# Altium project ezlo-thermostat-basic.PrjPcb (part 1 of 2)
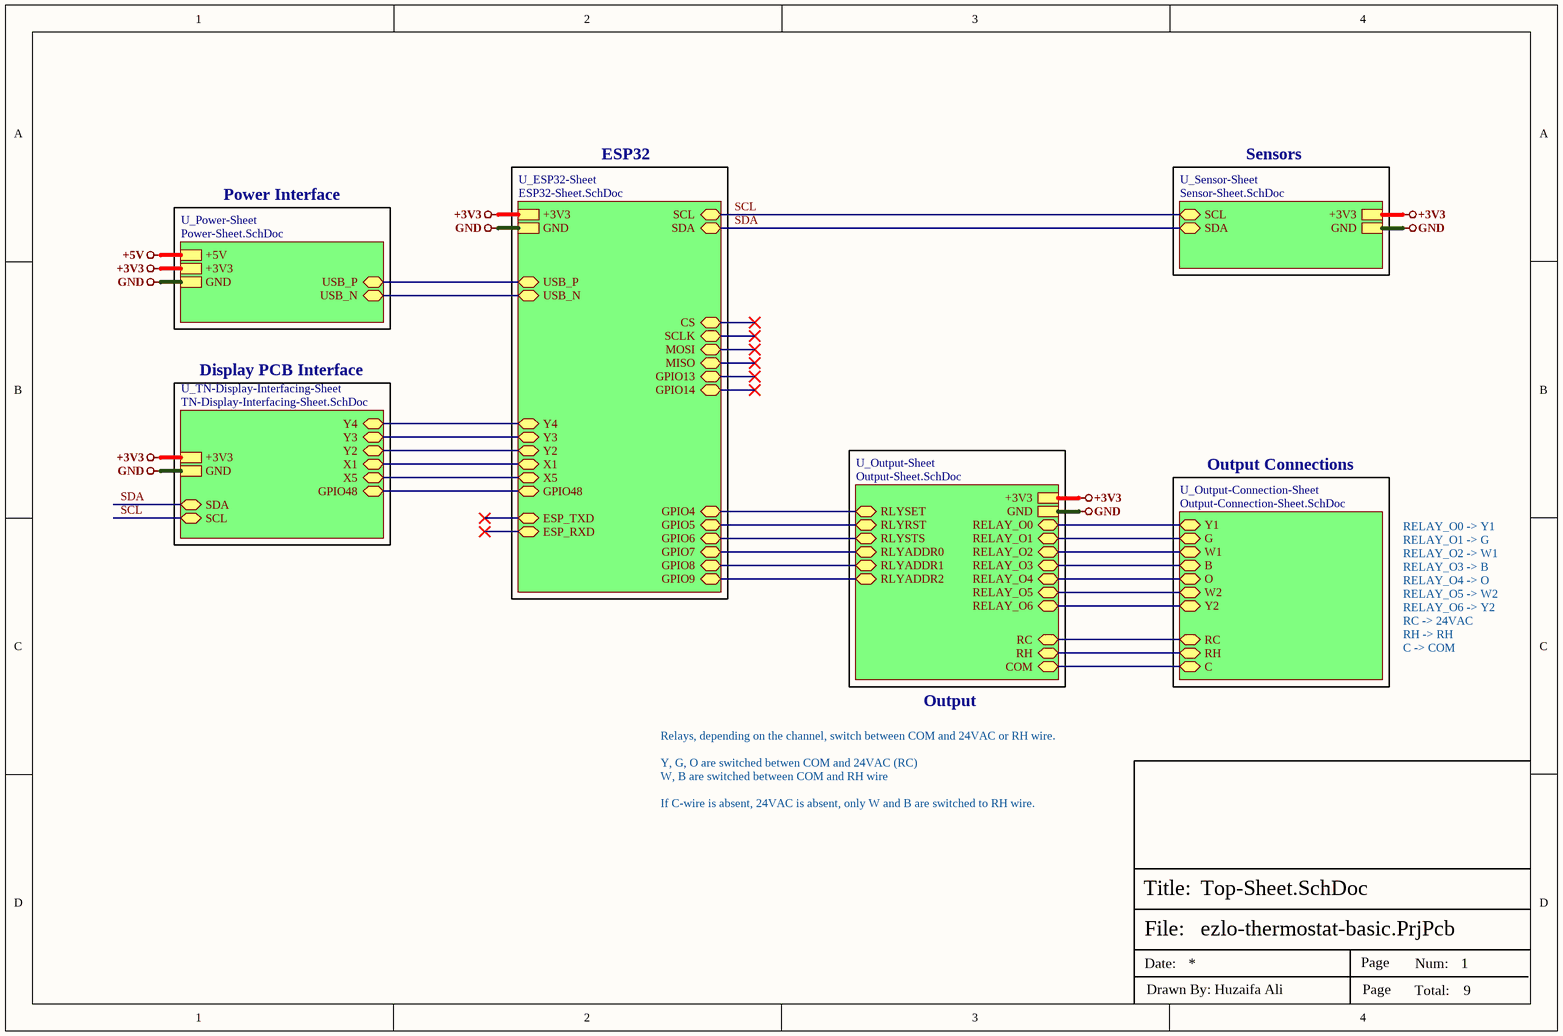
[diagram p0: Top-Sheet.SchDoc]
8 sheets, 122 parts. Net scope: hierarchical (ports join the sheet entries above them; power ports are global).
Board file: PCB-Thermostat.PcbDoc
Sheets:
  Top-Sheet.SchDoc
    U_Output-Sheet = Output-Sheet.SchDoc
      Relay0 = Relay-Sheet.SchDoc
      Relay1 = Relay-Sheet.SchDoc
      Relay2 = Relay-Sheet.SchDoc
      Relay3 = Relay-Sheet.SchDoc
      Relay4 = Relay-Sheet.SchDoc
      Relay5 = Relay-Sheet.SchDoc
      Relay6 = Relay-Sheet.SchDoc
    U_Output-Connection-Sheet = Output-Connection-Sheet.SchDoc
    U_ESP32-Sheet = ESP32-Sheet.SchDoc
    U_Sensor-Sheet = Sensor-Sheet.SchDoc
    U_Power-Sheet = Power-Sheet.SchDoc
    U_TN-Display-Interfacing-Sheet = TN-Display-Interfacing-Sheet.SchDoc

## Sheet Top-Sheet.SchDoc
size A4; SheetNumber: 1; SheetTotal: 9

### Sub-sheets
U_ESP32-Sheet = ESP32-Sheet.SchDoc: +3V3, GND, USB_P (bidir), USB_N (bidir), ESP_TXD (bidir), ESP_RXD (bidir), SCL (bidir), SDA (bidir), CS (bidir), SCLK (bidir), MOSI (bidir), MISO (bidir), GPIO13 (bidir), GPIO14 (bidir), GPIO4 (bidir), GPIO5 (bidir), GPIO6 (bidir), GPIO7 (bidir), GPIO8 (bidir), GPIO9 (bidir), Y4 (bidir), Y3 (bidir), Y2 (bidir), X1 (bidir), X5 (bidir), GPIO48 (bidir)
U_Output-Connection-Sheet = Output-Connection-Sheet.SchDoc: Y1 (bidir), G (bidir), W1 (bidir), RC (bidir), RH (bidir), B (bidir), O (bidir), W2 (bidir), Y2 (bidir), C (bidir)
U_Output-Sheet = Output-Sheet.SchDoc: +3V3, GND, RLYSET (bidir), RLYRST (bidir), RLYSTS (bidir), RLYADDR0 (bidir), RLYADDR1 (bidir), RLYADDR2 (bidir), RELAY_O0 (bidir), RELAY_O1 (bidir), RELAY_O2 (bidir), RELAY_O3 (bidir), RELAY_O4 (bidir), RELAY_O5 (bidir), RELAY_O6 (bidir), RC (bidir), RH (bidir), COM (bidir)
U_Power-Sheet = Power-Sheet.SchDoc: +5V, +3V3, GND, USB_P (bidir), USB_N (bidir)
U_Sensor-Sheet = Sensor-Sheet.SchDoc: +3V3, GND, SDA (bidir), SCL (bidir)
U_TN-Display-Interfacing-Sheet = TN-Display-Interfacing-Sheet.SchDoc: +3V3, GND, Y4 (bidir), Y3 (bidir), Y2 (bidir), X1 (bidir), X5 (bidir), GPIO48 (bidir), SDA (bidir), SCL (bidir)

### Nets
+3V3: sheet U_Output-Sheet/+3V3, sheet U_ESP32-Sheet/+3V3, sheet U_Sensor-Sheet/+3V3, sheet U_Power-Sheet/+3V3, sheet U_TN-Display-Interfacing-Sheet/+3V3
GND: sheet U_Output-Sheet/GND, sheet U_ESP32-Sheet/GND, sheet U_Sensor-Sheet/GND, sheet U_Power-Sheet/GND, sheet U_TN-Display-Interfacing-Sheet/GND
B: sheet U_Output-Sheet/RELAY_O3, sheet U_Output-Connection-Sheet/B
C: sheet U_Output-Sheet/COM, sheet U_Output-Connection-Sheet/C
G: sheet U_Output-Sheet/RELAY_O1, sheet U_Output-Connection-Sheet/G
GPIO4: sheet U_Output-Sheet/RLYSET, sheet U_ESP32-Sheet/GPIO4
GPIO5: sheet U_Output-Sheet/RLYRST, sheet U_ESP32-Sheet/GPIO5
GPIO6: sheet U_Output-Sheet/RLYSTS, sheet U_ESP32-Sheet/GPIO6
GPIO7: sheet U_Output-Sheet/RLYADDR0, sheet U_ESP32-Sheet/GPIO7
GPIO8: sheet U_Output-Sheet/RLYADDR1, sheet U_ESP32-Sheet/GPIO8
GPIO9: sheet U_Output-Sheet/RLYADDR2, sheet U_ESP32-Sheet/GPIO9
GPIO48: sheet U_ESP32-Sheet/GPIO48, sheet U_TN-Display-Interfacing-Sheet/GPIO48
O: sheet U_Output-Sheet/RELAY_O4, sheet U_Output-Connection-Sheet/O
RC: sheet U_Output-Sheet/RC, sheet U_Output-Connection-Sheet/RC
RELAY_IN: sheet U_Output-Sheet/RH, sheet U_Output-Connection-Sheet/RH
RELAY_O0: sheet U_Output-Sheet/RELAY_O0, sheet U_Output-Connection-Sheet/Y1
RELAY_O2: sheet U_Output-Sheet/RELAY_O2, sheet U_Output-Connection-Sheet/W1
RELAY_O5: sheet U_Output-Sheet/RELAY_O5, sheet U_Output-Connection-Sheet/W2
RELAY_O6: sheet U_Output-Sheet/RELAY_O6, sheet U_Output-Connection-Sheet/Y2
SCL: sheet U_ESP32-Sheet/SCL, sheet U_Sensor-Sheet/SCL, sheet U_TN-Display-Interfacing-Sheet/SCL
SDA: sheet U_ESP32-Sheet/SDA, sheet U_Sensor-Sheet/SDA, sheet U_TN-Display-Interfacing-Sheet/SDA
USB_N: sheet U_ESP32-Sheet/USB_N, sheet U_Power-Sheet/USB_N
USB_P: sheet U_ESP32-Sheet/USB_P, sheet U_Power-Sheet/USB_P
X1: sheet U_ESP32-Sheet/X1, sheet U_TN-Display-Interfacing-Sheet/X1
X5: sheet U_ESP32-Sheet/X5, sheet U_TN-Display-Interfacing-Sheet/X5
Y2: sheet U_ESP32-Sheet/Y2, sheet U_TN-Display-Interfacing-Sheet/Y2
Y3: sheet U_ESP32-Sheet/Y3, sheet U_TN-Display-Interfacing-Sheet/Y3
Y4: sheet U_ESP32-Sheet/Y4, sheet U_TN-Display-Interfacing-Sheet/Y4

### Notes on the sheet
- ESP32
- Sensors
- Power Interface
- Display PCB Interface
- Output Connections
- RELAY_O0 -> Y1
  RELAY_O1 -> G
  RELAY_O2 -> W1
  RELAY_O3 -> B
  RELAY_O4 -> O
  RELAY_O5 -> W2
  RELAY_O6 -> Y2
  RC -> 24VAC
  RH -> RH
  C -> COM
- Output
- Relays, depending on the channel, switch between COM and 24VAC or RH wire.
  Y, G, O are switched betwen COM and 24VAC (RC)
  W, B are switched between COM and RH wire
  If C-wire is absent, 24VAC is absent, only W and B are switched to RH wire.
- File:
- Title:
- Date:
- Page
- Num:
- Total:
- Drawn By: Huzaifa Ali

## Sheet Output-Sheet.SchDoc: =Projectname
size A4; SheetNumber: 4; SheetTotal: 9
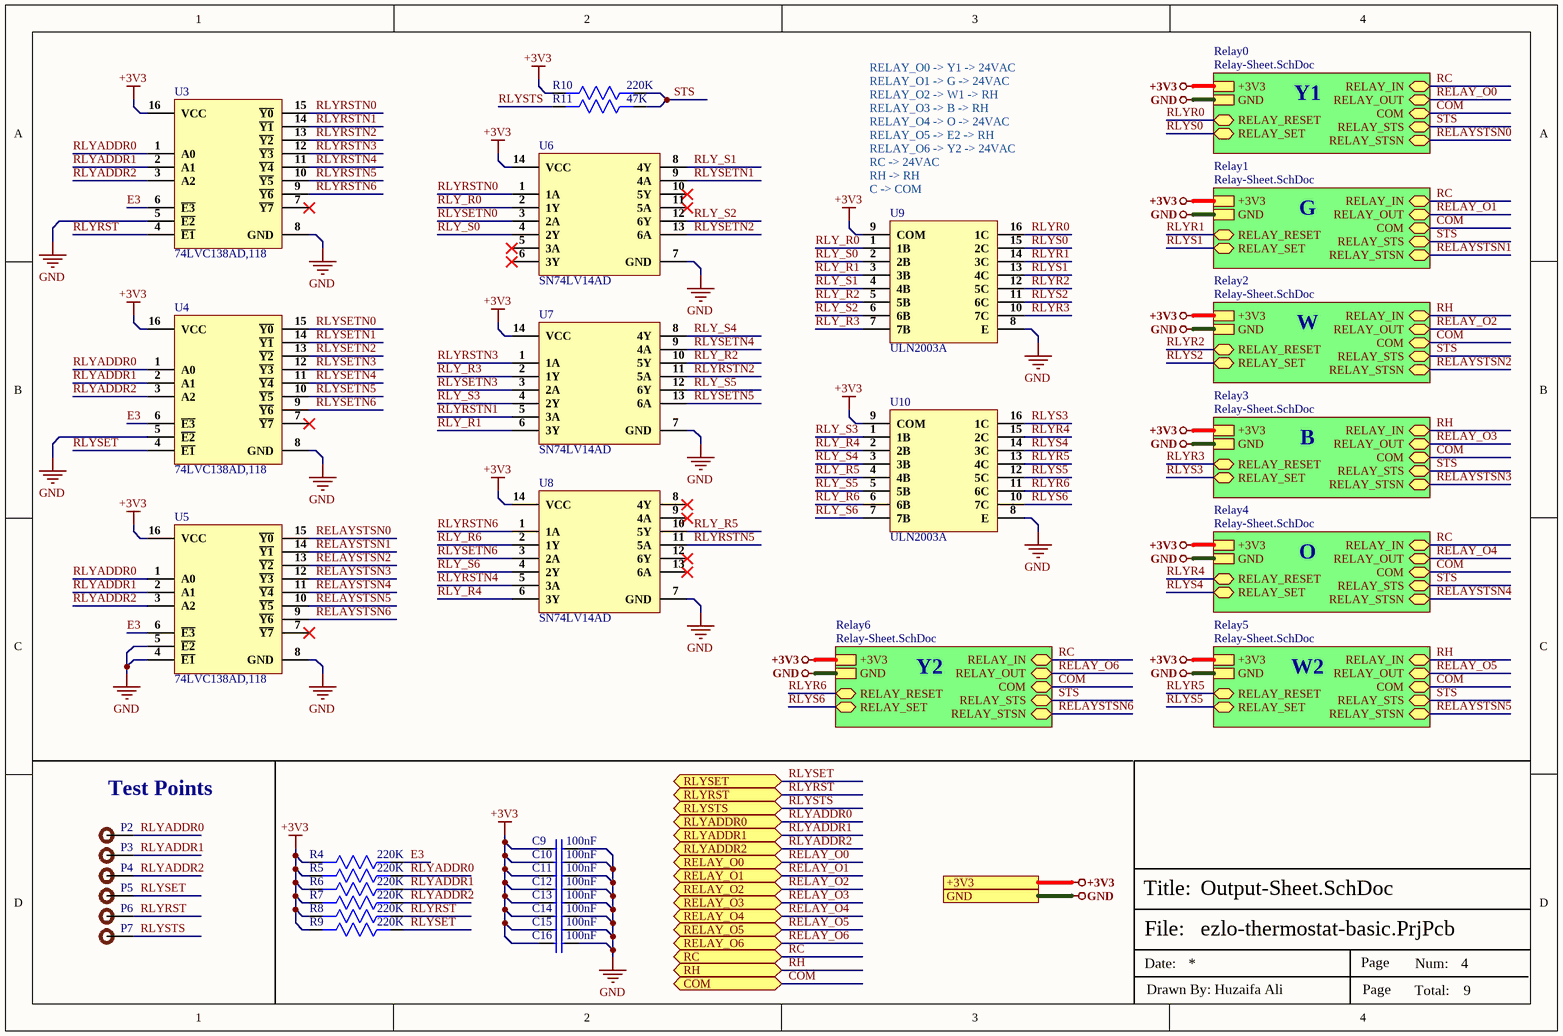
[diagram p1: Output-Sheet.SchDoc]

### Parts
C9  100nF  [Cap-0402]
C10  100nF  [Cap-0402]
C11  100nF  [Cap-0402]
C12  100nF  [Cap-0402]
C13  100nF  [Cap-0402]
C14  100nF  [Cap-0402]
C15  100nF  [Cap-0402]
C16  100nF  [Cap-0402]
P2  TEST POINT  [Test-point]  (value not drawn)
P3  TEST POINT  [Test-point]  (value not drawn)
P4  TEST POINT  [Test-point]  (value not drawn)
P5  TEST POINT  [Test-point]  (value not drawn)
P6  TEST POINT  [Test-point]  (value not drawn)
P7  TEST POINT  [Test-point]  (value not drawn)
R4  220K  [Res-0402]
R5  220K  [Res-0402]
R6  220K  [Res-0402]
R7  220K  [Res-0402]
R8  220K  [Res-0402]
R9  220K  [Res-0402]
R10  220K  [Res-0402]
R11  47K  [Res-0402]
U3  74LVC138AD,118  [16-SOIC]
U4  74LVC138AD,118  [16-SOIC]
U5  74LVC138AD,118  [16-SOIC]
U6  SN74LV14AD  [14-SOIC]
U7  SN74LV14AD  [14-SOIC]
U8  SN74LV14AD  [14-SOIC]
U9  ULN2003A  [SOP-16_150mil]
U10  ULN2003A  [SOP-16_150mil]

### Sub-sheets
Relay0 = Relay-Sheet.SchDoc: +3V3, GND, RELAY_RESET (bidir), RELAY_SET (bidir), RELAY_IN (bidir), RELAY_OUT (bidir), COM (bidir), RELAY_STS (bidir), RELAY_STSN (bidir)
Relay1 = Relay-Sheet.SchDoc: +3V3, GND, RELAY_RESET (bidir), RELAY_SET (bidir), RELAY_IN (bidir), RELAY_OUT (bidir), COM (bidir), RELAY_STS (bidir), RELAY_STSN (bidir)
Relay2 = Relay-Sheet.SchDoc: +3V3, GND, RELAY_RESET (bidir), RELAY_SET (bidir), RELAY_IN (bidir), RELAY_OUT (bidir), COM (bidir), RELAY_STS (bidir), RELAY_STSN (bidir)
Relay3 = Relay-Sheet.SchDoc: +3V3, GND, RELAY_RESET (bidir), RELAY_SET (bidir), RELAY_IN (bidir), RELAY_OUT (bidir), COM (bidir), RELAY_STS (bidir), RELAY_STSN (bidir)
Relay4 = Relay-Sheet.SchDoc: +3V3, GND, RELAY_RESET (bidir), RELAY_SET (bidir), RELAY_IN (bidir), RELAY_OUT (bidir), COM (bidir), RELAY_STS (bidir), RELAY_STSN (bidir)
Relay5 = Relay-Sheet.SchDoc: +3V3, GND, RELAY_RESET (bidir), RELAY_SET (bidir), RELAY_IN (bidir), RELAY_OUT (bidir), COM (bidir), RELAY_STS (bidir), RELAY_STSN (bidir)
Relay6 = Relay-Sheet.SchDoc: +3V3, GND, RELAY_RESET (bidir), RELAY_SET (bidir), RELAY_IN (bidir), RELAY_OUT (bidir), COM (bidir), RELAY_STS (bidir), RELAY_STSN (bidir)

### Ports
+3V3, COM (bidir), GND, RC (bidir), RELAY_O0 (bidir), RELAY_O1 (bidir), RELAY_O2 (bidir), RELAY_O3 (bidir), RELAY_O4 (bidir), RELAY_O5 (bidir), RELAY_O6 (bidir), RH (bidir), RLYADDR0 (bidir), RLYADDR1 (bidir), RLYADDR2 (bidir), RLYRST (bidir), RLYSET (bidir), RLYSTS (bidir)

### Nets
+3V3: C9.1 C10.1 C11.1 C12.1 C13.1 C14.1 C15.1 C16.1 R4.2 R5.2 R6.2 R7.2 R8.2 R9.2 R10.2 U3.16(VCC) U4.16(VCC) U5.16(VCC) U6.14(VCC) U7.14(VCC) U8.14(VCC) U9.9(COM) U10.9(COM) ; port +3V3, sheet Relay0/+3V3, sheet Relay1/+3V3, sheet Relay2/+3V3, sheet Relay3/+3V3, sheet Relay4/+3V3, sheet Relay5/+3V3, sheet Relay6/+3V3
GND: C9.2 C10.2 C11.2 C12.2 C13.2 C14.2 C15.2 C16.2 U3.5(~{E2}) U3.8(GND) U4.5(~{E2}) U4.8(GND) U5.4(~{E1}) U5.5(~{E2}) U5.8(GND) U6.7(GND) U7.7(GND) U8.7(GND) U9.8(E) U10.8(E) ; port GND, sheet Relay0/GND, sheet Relay1/GND, sheet Relay2/GND, sheet Relay3/GND, sheet Relay4/GND, sheet Relay5/GND, sheet Relay6/GND
COM: port COM, sheet Relay0/COM, sheet Relay1/COM, sheet Relay2/COM, sheet Relay3/COM, sheet Relay4/COM, sheet Relay5/COM, sheet Relay6/COM  [project net C]
E3: R4.1 U3.6(~{E3}) U4.6(~{E3}) U5.6(~{E3})
RC: port RC, sheet Relay0/RELAY_IN, sheet Relay1/RELAY_IN, sheet Relay4/RELAY_IN, sheet Relay6/RELAY_IN
RELAY_O0: port RELAY_O0, sheet Relay0/RELAY_OUT
RELAY_O1: port RELAY_O1, sheet Relay1/RELAY_OUT  [project net G]
RELAY_O2: port RELAY_O2, sheet Relay2/RELAY_OUT
RELAY_O3: port RELAY_O3, sheet Relay3/RELAY_OUT  [project net B]
RELAY_O4: port RELAY_O4, sheet Relay4/RELAY_OUT  [project net O]
RELAY_O5: port RELAY_O5, sheet Relay5/RELAY_OUT
RELAY_O6: port RELAY_O6, sheet Relay6/RELAY_OUT
RELAYSTSN0: U5.15(~{Y0}) ; sheet Relay0/RELAY_STSN  [project net RELAY_STSN]
RELAYSTSN1: U5.14(~{Y1}) ; sheet Relay1/RELAY_STSN  [project net RELAY_STSN]
RELAYSTSN2: U5.13(~{Y2}) ; sheet Relay2/RELAY_STSN  [project net RELAY_STSN]
RELAYSTSN3: U5.12(~{Y3}) ; sheet Relay3/RELAY_STSN  [project net RELAY_STSN]
RELAYSTSN4: U5.11(~{Y4}) ; sheet Relay4/RELAY_STSN  [project net RELAY_STSN]
RELAYSTSN5: U5.10(~{Y5}) ; sheet Relay5/RELAY_STSN  [project net RELAY_STSN]
RELAYSTSN6: U5.9(~{Y6}) ; sheet Relay6/RELAY_STSN  [project net RELAY_STSN]
RH: port RH, sheet Relay2/RELAY_IN, sheet Relay3/RELAY_IN, sheet Relay5/RELAY_IN  [project net RELAY_IN]
RLY_R0: U6.2(1Y) U9.1(1B)
RLY_R1: U7.6(3Y) U9.3(3B)
RLY_R2: U7.10(5Y) U9.5(5B)
RLY_R3: U7.2(1Y) U9.7(7B)
RLY_R4: U8.6(3Y) U10.2(2B)
RLY_R5: U8.10(5Y) U10.4(4B)
RLY_R6: U8.2(1Y) U10.6(6B)
RLY_S0: U6.4(2Y) U9.2(2B)
RLY_S1: U6.8(4Y) U9.4(4B)
RLY_S2: U6.12(6Y) U9.6(6B)
RLY_S3: U7.4(2Y) U10.1(1B)
RLY_S4: U7.8(4Y) U10.3(3B)
RLY_S5: U7.12(6Y) U10.5(5B)
RLY_S6: U8.4(2Y) U10.7(7B)
RLYADDR0: P2.1 R5.1 U3.1(A0) U4.1(A0) U5.1(A0) ; port RLYADDR0  [project net GPIO7]
RLYADDR1: P3.1 R6.1 U3.2(A1) U4.2(A1) U5.2(A1) ; port RLYADDR1  [project net GPIO8]
RLYADDR2: P4.1 R7.1 U3.3(A2) U4.3(A2) U5.3(A2) ; port RLYADDR2  [project net GPIO9]
RLYR0: U9.16(1C) ; sheet Relay0/RELAY_RESET  [project net RELAY_RESET]
RLYR1: U9.14(3C) ; sheet Relay1/RELAY_RESET  [project net RELAY_RESET]
RLYR2: U9.12(5C) ; sheet Relay2/RELAY_RESET  [project net RELAY_RESET]
RLYR3: U9.10(7C) ; sheet Relay3/RELAY_RESET  [project net RELAY_RESET]
RLYR4: U10.15(2C) ; sheet Relay4/RELAY_RESET  [project net RELAY_RESET]
RLYR5: U10.13(4C) ; sheet Relay5/RELAY_RESET  [project net RELAY_RESET]
RLYR6: U10.11(6C) ; sheet Relay6/RELAY_RESET  [project net RELAY_RESET]
RLYRST: P6.1 R8.1 U3.4(~{E1}) ; port RLYRST  [project net GPIO5]
RLYRSTN0: U3.15(~{Y0}) U6.1(1A)
RLYRSTN1: U3.14(~{Y1}) U7.5(3A)
RLYRSTN2: U3.13(~{Y2}) U7.11(5A)
RLYRSTN3: U3.12(~{Y3}) U7.1(1A)
RLYRSTN4: U3.11(~{Y4}) U8.5(3A)
RLYRSTN5: U3.10(~{Y5}) U8.11(5A)
RLYRSTN6: U3.9(~{Y6}) U8.1(1A)
RLYS0: U9.15(2C) ; sheet Relay0/RELAY_SET  [project net RELAY_SET]
RLYS1: U9.13(4C) ; sheet Relay1/RELAY_SET  [project net RELAY_SET]
RLYS2: U9.11(6C) ; sheet Relay2/RELAY_SET  [project net RELAY_SET]
RLYS3: U10.16(1C) ; sheet Relay3/RELAY_SET  [project net RELAY_SET]
RLYS4: U10.14(3C) ; sheet Relay4/RELAY_SET  [project net RELAY_SET]
RLYS5: U10.12(5C) ; sheet Relay5/RELAY_SET  [project net RELAY_SET]
RLYS6: U10.10(7C) ; sheet Relay6/RELAY_SET  [project net RELAY_SET]
RLYSET: P5.1 R9.1 U4.4(~{E1}) ; port RLYSET  [project net GPIO4]
RLYSETN0: U4.15(~{Y0}) U6.3(2A)
RLYSETN1: U4.14(~{Y1}) U6.9(4A)
RLYSETN2: U4.13(~{Y2}) U6.13(6A)
RLYSETN3: U4.12(~{Y3}) U7.3(2A)
RLYSETN4: U4.11(~{Y4}) U7.9(4A)
RLYSETN5: U4.10(~{Y5}) U7.13(6A)
RLYSETN6: U4.9(~{Y6}) U8.3(2A)
RLYSTS: P7.1 R11.2 ; port RLYSTS  [project net GPIO6]
STS: R10.1 R11.1 ; sheet Relay0/RELAY_STS, sheet Relay1/RELAY_STS, sheet Relay2/RELAY_STS, sheet Relay3/RELAY_STS, sheet Relay4/RELAY_STS, sheet Relay5/RELAY_STS, sheet Relay6/RELAY_STS  [project net RELAY_STS]

Not connected (* = marked no-connect by the designer): U3 7(~{Y7})*; U4 7(~{Y7})*; U5 7(~{Y7})*; U6 5(3A)* 6(3Y)* 10(5Y)* 11(5A)*; U8 8(4Y)* 9(4A)* 12(6Y)* 13(6A)*

### Notes on the sheet
- Y1
- (near U9) RELAY_O0 -> Y1 -> 24VAC
  RELAY_O1 -> G -> 24VAC
  RELAY_O2 -> W1 -> RH
  RELAY_O3 -> B -> RH
  RELAY_O4 -> O -> 24VAC
  RELAY_O5 -> E2 -> RH
  RELAY_O6 -> Y2 -> 24VAC
  RC -> 24VAC
  RH -> RH
  C -> COM
- G
- W
- B
- O
- Y2
- W2
- Test Points
- File:
- Title:
- Date:
- Page
- Num:
- Total:
- Drawn By: Huzaifa Ali

### Library data of the parts
C9-C16 = CC0402KRX5R8BB104: CAP CER 0.1UF 25V X5R 0402; Manufacturer: Yageo; Tolerance: 10%; Item Type: Capacitor; Supplier 1: Digi-Key; Manufacturer Part Number: CC0402KRX5R8BB104; RoHS: Yes; Category: Ceramic Capacitors; Stock 1: 4598218; Pricing 1: 1=0.10000, 10=0.03800, 50=0.02100, 100=0.01710, 500=0.01224, 1000=0.00961, 2500=0.00874, 5000=0.00804 (USD); Mount: Surface Mount; Case/Package: 0402; Case Code (Metric): 1005; Case Code (Imperial): 0402; Min Operating Temperature: -55°C; Max Operating Temperature: 85°C; Voltage Rating: 25V; Packaging: Tape and Reel; Capacitance: 100nF; Voltage Rating (DC): 25V; Dielectric: X5R; Resistor Type: Ceramic; Series: CC; Length: 0.039inch; Width: 0.02inch; Thickness: 0.022inch; Depth: 0.5mm; Lead Free: Lead Free; Halogen Free: Halogen Free; RoHS Compliant: Yes; ComponentLink1URL: http://www.mouser.com/ds/2/447/UPY-GPHC_X5R_4V-to-50V_25-1131599.pdf?src-supplier=Mouser; ComponentLink1Description: http://www.mouser.com/ds/2/447/UPY-GPHC_X5R_4V-to-50V_25-1131599.pdf?src-supplier=Mouser; ComponentLink2URL: http://www.yageo.com/documents/recent/UPY-GPHC_X5R_4V-to-50V-16.pdf?src-supplier=Future+Electronics; ComponentLink2Description: http://www.yageo.com/documents/recent/UPY-GPHC_X5R_4V-to-50V-16.pdf?src-supplier=Future+Electronics; ComponentLink3URL: http://www.yageo.com/documents/recent/UPY-GPHC_X5R_4V-to-50V_25.pdf?src-supplier=Digi-Key; ComponentLink3Description: http://www.yageo.com/documents/recent/UPY-GPHC_X5R_4V-to-50V_25.pdf?src-supplier=Digi-Key; Supplier Part Number 1: 311-1697-1-ND; LCSC Part Number: C106256
P2-P7 = TEST POINT: Test Point ON
R4-R10 = RC0402FR-07220KL: RES 220K OHM 1% 1/16W 0402; Manufacturer: Yageo; Resistance: 220kR; Power Rating: 62.5mW; Voltage Rating: 50V; Temperature Coefficient: 100ppm/°C; Max Power Dissipation: 63mW; Supplier 1: Digi-Key; Manufacturer Part Number: RC0402FR-07220KL; RoHS: Yes; Category: Chip SMD Resistors; Stock 1: 1192792; Pricing 1: 1=0.10000, 10=0.01400, 100=0.00580, 1000=0.00262, 2500=0.00228, 5000=0.00188 (USD); Case/Package: 0402; Case Code (Imperial): 0402; Case Code (Metric): 1005; Weight: 2.3E-05oz; Size Code: 0402; Min Operating Temperature: -55°C; Max Operating Temperature: 155°C; Tolerance: 1%; Package Quantity: 1; Packaging: Tape and Reel; Termination: SMD/SMT; Resistor Type: Thick Film; Number of Terminations: 2; Features: Moisture Resistant; Series: RC; Resistance Tolerance: 1%; Technology: THICK FILM; Construction: Rectangular; Length: 1mm; Width: 0.02inch; Height: 0.016inch; Depth: 0.5mm; RoHS Compliant: Yes; Reach SVHC Compliant: Yes; Military Standard: Not; Lead Free: Lead Free; ComponentLink1URL: https://datasheet.ciiva.com/11808/0900766b80c66297-11808792.pdf?src-supplier=RSComponents; ComponentLink1Description: https://datasheet.ciiva.com/11808/0900766b80c66297-11808792.pdf?src-supplier=RSComponents; ComponentLink2URL: https://datasheet.ciiva.com/5924/1018594-5924944.pdf?src-supplier=Farnell; ComponentLink2Description: https://datasheet.ciiva.com/5924/1018594-5924944.pdf?src-supplier=Farnell; ComponentLink3URL: https://datasheet.ciiva.com/2453/pyu-r-int-thick-7-2453533.pdf?src-supplier=Digi-Key; ComponentLink3Description: https://datasheet.ciiva.com/2453/pyu-r-int-thick-7-2453533.pdf?src-supplier=Digi-Key; ComponentLink4URL: https://datasheet.ciiva.com/2453/pyu-r-int-thick-7-2453534.pdf?src-supplier=Digi-Key; ComponentLink4Description: https://datasheet.ciiva.com/2453/pyu-r-int-thick-7-2453534.pdf?src-supplier=Digi-Key; ComponentLink5URL: https://datasheet.ciiva.com/2453/pyu-r-int-thick-7-2453532.pdf?src-supplier=Digi-Key; ComponentLink5Description: https://datasheet.ciiva.com/2453/pyu-r-int-thick-7-2453532.pdf?src-supplier=Digi-Key; ComponentLink6URL: https://datasheet.ciiva.com/12577/pyu-rc0402-51-rohs-l-6-r-12577270.pdf?src-supplier=Mouser; ComponentLink6Description: https://datasheet.ciiva.com/12577/pyu-rc0402-51-rohs-l-6-r-12577270.pdf?src-supplier=Mouser; Supplier Part Number 1: 311-220KLRCT-ND
R11 = RC0402FR-0747KL: RES 47K OHM 1% 1/16W 0402; Manufacturer: Yageo; Power Rating: 62.5mW; Temperature Coefficient: 100ppm/°C; Voltage Rating: 50V; Resistance: 47kR; Max Power Dissipation: 63mW; Item Type: Resistor; Supplier 1: Avnet; Manufacturer Part Number: RC0402FR-0747KL; RoHS: Yes; Category: Chip SMD Resistors; Stock 1: 680000; Pricing 1: 10000=0.00085, 20000=0.00087, 40000=0.00084, 60000=0.00083, 80000=0.00079, 100000=0.00078, 1000000=0.00076 (USD); Case/Package: 0402; Case Code (Imperial): 0402; Case Code (Metric): 1005; Size Code: 0402; Min Operating Temperature: -55°C; Max Operating Temperature: 155°C; Tolerance: 1%; Series: RC; Packaging: Tape and Reel; Package Quantity: 1; Termination: SMD/SMT; Resistor Type: Thick Film; Number of Terminations: 2; Features: Moisture Resistant; Resistance Tolerance: 1%; Construction: Rectangular; Length: 1mm; Width: 0.02inch; Height: 0.016inch; Depth: 0.5mm; RoHS Compliant: Yes; Military Standard: Not; Lead Free: Lead Free; ComponentLink1URL: https://datasheet.ciiva.com/46412/1018594-46412839.pdf?src-supplier=Element14; ComponentLink1Description: https://datasheet.ciiva.com/46412/1018594-46412839.pdf?src-supplier=Element14; ComponentLink2URL: https://datasheet.ciiva.com/2453/pyu-r-int-thick-7-2453389.pdf?src-supplier=Digi-Key; ComponentLink2Description: https://datasheet.ciiva.com/2453/pyu-r-int-thick-7-2453389.pdf?src-supplier=Digi-Key; ComponentLink3URL: https://datasheet.ciiva.com/2453/pyu-r-int-thick-7-2453390.pdf?src-supplier=Digi-Key; ComponentLink3Description: https://datasheet.ciiva.com/2453/pyu-r-int-thick-7-2453390.pdf?src-supplier=Digi-Key; ComponentLink4URL: https://datasheet.ciiva.com/2453/pyu-r-int-thick-7-2453388.pdf?src-supplier=Digi-Key; ComponentLink4Description: https://datasheet.ciiva.com/2453/pyu-r-int-thick-7-2453388.pdf?src-supplier=Digi-Key; ComponentLink5URL: https://datasheet.ciiva.com/15189/getdatasheetpartid-323748-15189466.pdf?src-supplier=Verical; ComponentLink5Description: https://datasheet.ciiva.com/15189/getdatasheetpartid-323748-15189466.pdf?src-supplier=Verical; ComponentLink6URL: https://datasheet.ciiva.com/16793/pyu-rc0402-51-rohs-l-6-r-16793430.pdf?src-supplier=Future+Electronics; ComponentLink6Description: https://datasheet.ciiva.com/16793/pyu-rc0402-51-rohs-l-6-r-16793430.pdf?src-supplier=Future+Electronics; Supplier Part Number 1: RC0402FR-0747KL; LCSC Part Number: C93943
U3-U5 = 74LVC138AD,118: IC DECODER/DEMUX 3-8 INV 16SOIC; Manufacturer: Nexperia; Supplier 1: Avnet; Manufacturer Part Number: 74LVC138AD,118; RoHS: Yes; Category: Decoders and Multiplexers; Stock 1: 17684; Pricing 1: 2995=0.11690, 3000=0.11440, 6000=0.11189, 15000=0.10939, 30000=0.10688, 150000=0.10438, 300000=0.10187 (USD); RoHS Compliant: Yes; Supplier Part Number 1: 74LVC138AD,118; LCSC Part Number: C6061; Item Type: IC; ComponentLink1Description: LCSC; ComponentLink1URL: https://www.lcsc.com/product-detail/Signal-Switches-Encoders-Decoders-Multiplexers_Nexperia-74LVC138AD-118_C6061.html
U6-U8 = SN74LV14AD: SOIC-14 Inverters ROHS; Manufacturer: Texas Instruments; Logic Function: Buffer,Inverter,Schmitt Trigger; Number of Elements: 6; Output Current: 12mA; Number of Inputs: 1; Min Supply Voltage: 2V; Max Supply Voltage: 5.5V; Propagation Delay: 27ns; Quiescent Current: 20uA; High Level Output Current: -12mA; Turn-On Delay Time: 12ns; Input Type: SCHMITT TRIGGER; Schmitt Trigger Input: Yes; Item Type: IC; Supplier 1: Digi-Key; Manufacturer Part Number: SN74LV14AD; RoHS: Yes; Category: Logic Gates; Stock 1: 2467; Pricing 1: 1=1.16000, 10=1.04100, 25=0.98840, 100=0.81190, 250=0.75892, 500=0.67066, 1000=0.52947, 2500=0.49950 (USD); Mount: Surface Mount; Case/Package: SOIC; Number of Pins: 14; Weight: 0.004318oz; Min Operating Temperature: -40°C; Max Operating Temperature: 125°C; Package Quantity: 50; Packaging: Rail/Tube; Number of Circuits: 6; Low Level Output Current: 12mA; Series: 74LV; Technology: CMOS; Number of Bits: 6; Number of Gates: 6; Length: 8.65mm; Width: 3.91mm; Height: 1.58mm; Radiation Hardening: No; Lead Free: Lead Free; RoHS Compliant: Yes; Reach SVHC Compliant: Yes; ComponentLink1URL: https://datasheet.ciiva.com/27050/917231-27050962.pdf?src-supplier=Jameco; ComponentLink1Description: https://datasheet.ciiva.com/27050/917231-27050962.pdf?src-supplier=Jameco; ComponentLink2URL: https://datasheet.ciiva.com/7948/1633820-7948979.pdf?src-supplier=Element14; ComponentLink2Description: https://datasheet.ciiva.com/7948/1633820-7948979.pdf?src-supplier=Element14; ComponentLink3URL: https://datasheet.ciiva.com/15089/getdatasheetpartid-253475-15089486.pdf?src-supplier=Verical; ComponentLink3Description: https://datasheet.ciiva.com/15089/getdatasheetpartid-253475-15089486.pdf?src-supplier=Verical; ComponentLink4URL: https://datasheet.ciiva.com/1866/sn74lv14a-1866324.pdf?src-supplier=Digi-Key; ComponentLink4Description: https://datasheet.ciiva.com/1866/sn74lv14a-1866324.pdf?src-supplier=Digi-Key; ComponentLink5URL: https://datasheet.ciiva.com/14290/sn74lv14a-14290269.pdf?src-supplier=Avnet; ComponentLink5Description: https://datasheet.ciiva.com/14290/sn74lv14a-14290269.pdf?src-supplier=Avnet; Supplier Part Number 1: 296-1678-5-ND; LCSC Part Number: C2860778
U9 U10 = ULN2003A: 100uA@50V 3V@2V,300mA 1.6V@350mA 4mA@12V 100uA@50V 1.25V@350mA 500mA 25pF SOP-16_150mil Darlington Transistor Arrays ROHS; Manufacturer: Mixic; Item Type: IC; Manufacturer Part Number: ULN2003A; Package: SOP-16_150mil; LCSC Part Number: C181730; ComponentLink1Description: LCSC; ComponentLink1URL: https://www.lcsc.com/product-detail/Darlington-Transistor-Arrays_Mixic-ULN2003A_C181730.html

## Sheet Relay-Sheet.SchDoc: =Projectname
size A4; SheetNumber: 6; SheetTotal: 9
Used 7 times, as channels U_Output-Sheet/Relay0, U_Output-Sheet/Relay1, U_Output-Sheet/Relay2, U_Output-Sheet/Relay3, U_Output-Sheet/Relay4, U_Output-Sheet/Relay5, U_Output-Sheet/Relay6. Parts and nets are listed once, with the designators drawn on the sheet.
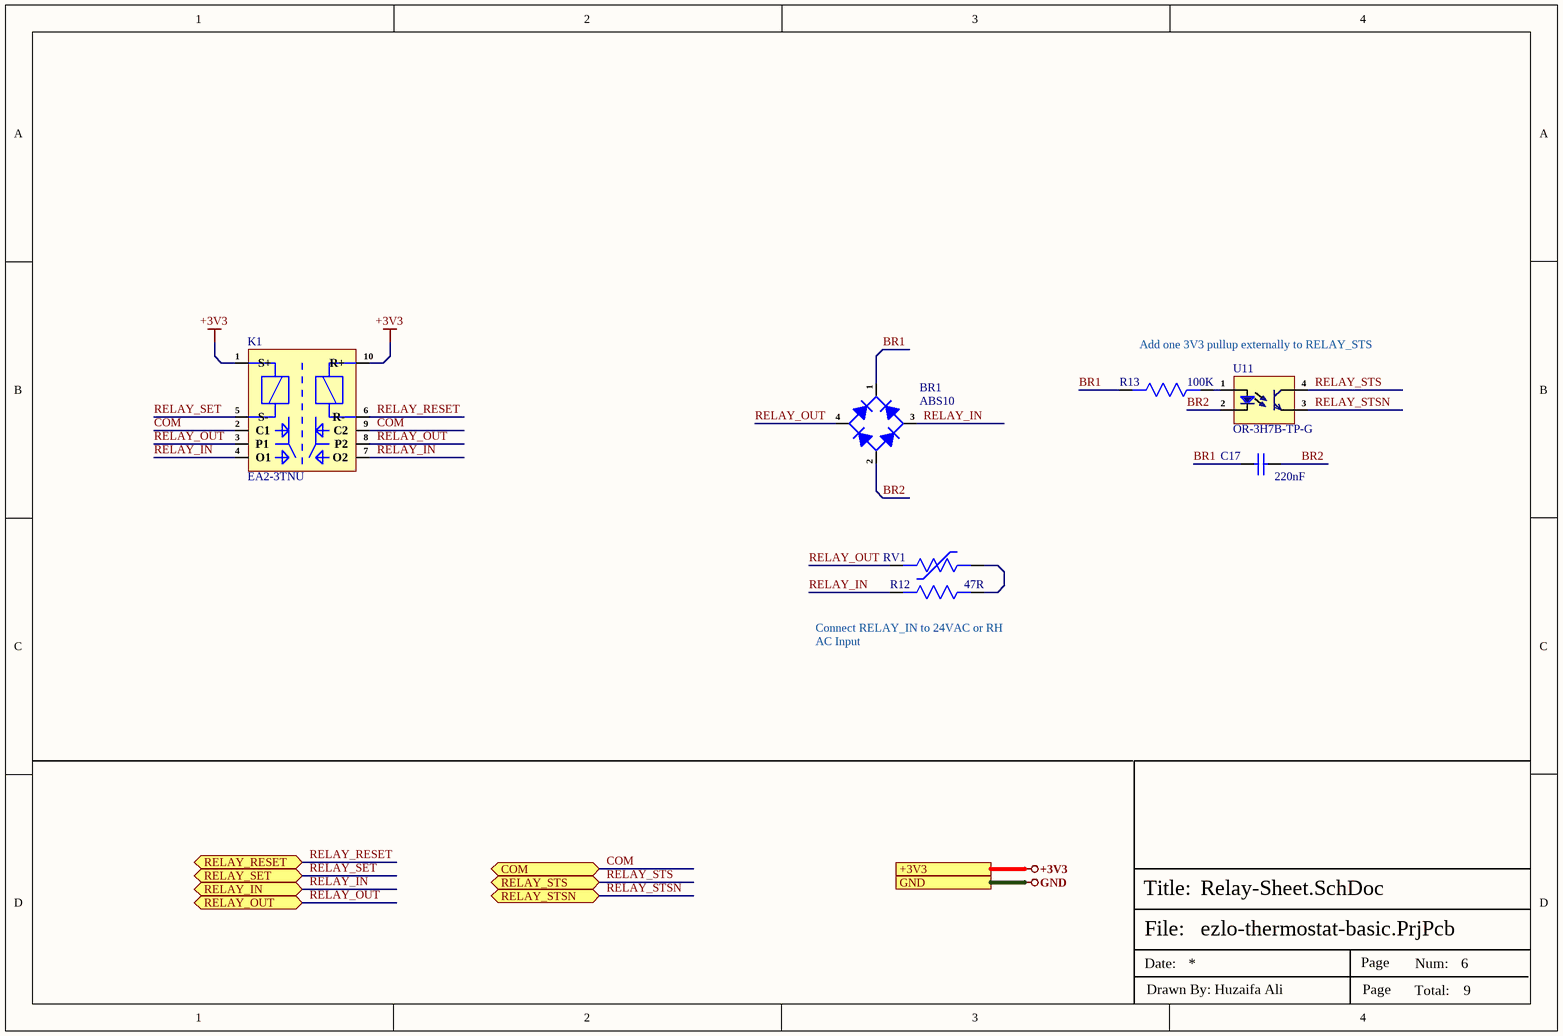
[diagram p2: Relay-Sheet.SchDoc]

### Parts
BR1  ABS10  [ABS]
C17  220nF  [Cap-1206]
K1  EA2-3TNU  [EA2-3TNU]
R12  47R  [Res-0402]
R13  100K  [Res-0402]
RV1  ERZ-V07D680  [ERZ-V07D680]  (value not drawn)
U11  OR-3H7B-TP-G  [SOP-4-1.27mm pitch Body 2.6mm]

### Ports
+3V3, COM (bidir), GND, RELAY_IN (bidir), RELAY_OUT (bidir), RELAY_RESET (bidir), RELAY_SET (bidir), RELAY_STS (bidir), RELAY_STSN (bidir)

### Nets
+3V3: K1.1(S+) K1.10(R+) ; port +3V3
BR1: BR1.1 C17.2 R13.2
BR2: BR1.2 C17.1 U11.2(Ca)
COM: K1.2(C1) K1.9(C2) ; port COM
RELAY_IN: BR1.3 K1.4(O1) K1.7(O2) R12.2 ; port RELAY_IN
RELAY_OUT: BR1.4 K1.3(P1) K1.8(P2) RV1.2 ; port RELAY_OUT
RELAY_RESET: K1.6(R-) ; port RELAY_RESET
RELAY_SET: K1.5(S-) ; port RELAY_SET
RELAY_STS: U11.4(C) ; port RELAY_STS
RELAY_STSN: U11.3(E) ; port RELAY_STSN
NetR12_1: R12.1 RV1.1
NetR13_1: R13.1 U11.1(An)

### Channels
U_Output-Sheet/Relay0: designators end in _Relay0; ports +3V3=+3V3 COM=C GND=GND RELAY_IN=RC RELAY_OUT=RELAY_O0 RELAY_RESET=RELAY_RESET RELAY_SET=RELAY_SET RELAY_STS=RELAY_STS RELAY_STSN=RELAY_STSN
U_Output-Sheet/Relay1: designators end in _Relay1; ports +3V3=+3V3 COM=C GND=GND RELAY_IN=RC RELAY_OUT=G RELAY_RESET=RELAY_RESET RELAY_SET=RELAY_SET RELAY_STS=RELAY_STS RELAY_STSN=RELAY_STSN
U_Output-Sheet/Relay2: designators end in _Relay2; ports +3V3=+3V3 COM=C GND=GND RELAY_IN=RELAY_IN RELAY_OUT=RELAY_O2 RELAY_RESET=RELAY_RESET RELAY_SET=RELAY_SET RELAY_STS=RELAY_STS RELAY_STSN=RELAY_STSN
U_Output-Sheet/Relay3: designators end in _Relay3; ports +3V3=+3V3 COM=C GND=GND RELAY_IN=RELAY_IN RELAY_OUT=B RELAY_RESET=RELAY_RESET RELAY_SET=RELAY_SET RELAY_STS=RELAY_STS RELAY_STSN=RELAY_STSN
U_Output-Sheet/Relay4: designators end in _Relay4; ports +3V3=+3V3 COM=C GND=GND RELAY_IN=RC RELAY_OUT=O RELAY_RESET=RELAY_RESET RELAY_SET=RELAY_SET RELAY_STS=RELAY_STS RELAY_STSN=RELAY_STSN
U_Output-Sheet/Relay5: designators end in _Relay5; ports +3V3=+3V3 COM=C GND=GND RELAY_IN=RELAY_IN RELAY_OUT=RELAY_O5 RELAY_RESET=RELAY_RESET RELAY_SET=RELAY_SET RELAY_STS=RELAY_STS RELAY_STSN=RELAY_STSN
U_Output-Sheet/Relay6: designators end in _Relay6; ports +3V3=+3V3 COM=C GND=GND RELAY_IN=RC RELAY_OUT=RELAY_O6 RELAY_RESET=RELAY_RESET RELAY_SET=RELAY_SET RELAY_STS=RELAY_STS RELAY_STSN=RELAY_STSN

### Notes on the sheet
- Add one 3V3 pullup externally to RELAY_STS
- (near R12) Connect RELAY_IN to 24VAC or RH
  AC Input
- File:
- Title:
- Date:
- Page
- Num:
- Total:
- Drawn By: Huzaifa Ali

### Library data of the parts
BR1 = ABS10: 5uA@1kV 1V@0.4A 1A 1kV -55℃~+150℃@(Tj) ABS Bridge Rectifiers ROHS; Manufacturer: FOSAN; Package: ABS; Manufacturer Part Number: ABS10; Item Type: Bridge Rectifier; LCSC Part Number: C3014049; ComponentLink1Description: LCSC; ComponentLink1URL: https://www.lcsc.com/product-detail/Bridge-Rectifiers_FOSAN-ABS10_C3014049.html
C17 = 1206B224K500NT: 50V 220nF X7R ±10% 1206 Multilayer Ceramic Capacitors MLCC - SMD/SMT ROHS; Manufacturer: FH; Manufacturer Part Number: 1206B224K500NT; Package: 1206; LCSC Part Number: C1857; Item Type: Capacitor; ComponentLink1Description: LCSC; ComponentLink1URL: https://www.lcsc.com/product-detail/Multilayer-Ceramic-Capacitors-MLCC-SMD-SMT_FH-Guangdong-Fenghua-Advanced-Tech-1206B224K500NT_C1857.html
K1 = EA2-3TNU: Relay Gen Purpose DPDT 1A 3VDC; Manufacturer: KEMET; Coil Current: 46.7mA; Coil Type: Latching, Dual Coil; Coil Voltage (DC): 3V; Coil Resistance: 64.3R; Relay Type: General Purpose; Operate Time: 2ms; Release Time: 1ms; Coil Power: 140mW; Supplier 1: Mouser; Manufacturer Part Number: EA2-3TNU; RoHS: No; Category: Uncategorized; Stock 1: 873; Pricing 1: 1=3.85000, 10=3.11000, 50=3.11000, 100=2.42000, 250=2.00000, 500=1.85000, 1000=1.85000, 3600=1.58000, 10000=1.58000 (USD); Mount: Through Hole; Contact Material: Gold,Silver; Min Operating Temperature: -40°C; Max Operating Temperature: 85°C; Throw Configuration: DPDT; Package Quantity: 3600; Termination: PC Pin; Packaging: Rail/Tube; Contact Current Rating: 1A; RoHS Compliant: No; ComponentLink1URL: https://api.kemet.com/component-edge/download/datasheet/EA2-3TNU.pdf?src-supplier=Digi-Key; ComponentLink1Description: https://api.kemet.com/component-edge/download/datasheet/EA2-3TNU.pdf?src-supplier=Digi-Key; Supplier Part Number 1: 80-EA2-3TNU; LCSC Part Number: C1560650; Item Type: Relay
R12 = RC0402FR-0747RL: RES 47 OHM 1% 1/16W 0402; Manufacturer: Yageo; Temperature Coefficient: 100ppm/°C; Power Rating: 63mW; Voltage Rating: 50V; Supplier 1: Digi-Key; Manufacturer Part Number: RC0402FR-0747RL; RoHS: Yes; Category: Chip SMD Resistors; Stock 1: 913647; Pricing 1: 1=0.10000, 10=0.01400, 100=0.00580, 1000=0.00262, 2500=0.00228, 5000=0.00188 (USD); Case/Package: 0402; Case Code (Metric): 1005; Case Code (Imperial): 0402; Weight: 2.3E-05oz; Size Code: 0402; Min Operating Temperature: -55°C; Max Operating Temperature: 155°C; Resistance: 47R; Tolerance: 1%; Packaging: Tape and Reel; Resistor Type: Thick Film; Package Quantity: 1; Number of Terminations: 2; Termination: SMD/SMT; Max Power Dissipation: 63mW; Features: Moisture Resistant; Series: RC; Construction: Rectangular; Technology: THICK FILM; Resistance Tolerance: 1%; Length: 1mm; Width: 0.02inch; Height: 0.016inch; Depth: 0.5mm; Lead Free: Lead Free; Military Standard: Not; RoHS Compliant: Yes; Supplier Part Number 1: 311-47.0LRCT-ND
R13 = RC0402FR-07100KL: RES 100K OHM 1% 1/16W 0402; Manufacturer: Yageo; Resistance: 100kR; Temperature Coefficient: 100ppm/°C; Power Rating: 63mW; Voltage Rating: 50V; Supplier 1: Mouser; Manufacturer Part Number: RC0402FR-07100KL; RoHS: Yes; Category: Chip SMD Resistors; Stock 1: 7759549; Pricing 1: 1=0.10000, 10=0.01200, 50=0.01200, 100=0.00500, 1000=0.00300, 2500=0.00200, 10000=0.00100 (USD); Case/Package: 0402; Case Code (Metric): 1005; Case Code (Imperial): 0402; Min Operating Temperature: -55°C; Max Operating Temperature: 155°C; Resistor Type: Thick Film; Tolerance: 1%; Packaging: Tape and Reel; Package Quantity: 1; Number of Terminations: 2; Termination: SMD/SMT; Max Power Dissipation: 63mW; Working Voltage: 50V; Features: Moisture Resistant; Series: RC; Resistance Tolerance: 1%; Construction: Rectangular; Technology: THICK FILM; Length: 0.039inch; Width: 0.02inch; Height: 0.016inch; Depth: 0.5mm; REACH SVHC: No SVHC; Lead Free: Lead Free; RoHS Compliant: Yes; Military Standard: Not; ComponentLink1URL: https://datasheet.ciiva.com/11819/0900766b80c66297-11819452.pdf?src-supplier=RSComponents; ComponentLink1Description: https://datasheet.ciiva.com/11819/0900766b80c66297-11819452.pdf?src-supplier=RSComponents; ComponentLink2URL: https://datasheet.ciiva.com/22747/1018594-22747509.pdf?src-supplier=Element14; ComponentLink2Description: https://datasheet.ciiva.com/22747/1018594-22747509.pdf?src-supplier=Element14; ComponentLink3URL: https://datasheet.ciiva.com/2453/pyu-r-int-thick-7-2453362.pdf?src-supplier=Digi-Key; ComponentLink3Description: https://datasheet.ciiva.com/2453/pyu-r-int-thick-7-2453362.pdf?src-supplier=Digi-Key; ComponentLink4URL: https://datasheet.ciiva.com/2453/pyu-r-int-thick-7-2453363.pdf?src-supplier=Digi-Key; ComponentLink4Description: https://datasheet.ciiva.com/2453/pyu-r-int-thick-7-2453363.pdf?src-supplier=Digi-Key; ComponentLink5URL: https://datasheet.ciiva.com/2453/pyu-r-int-thick-7-2453361.pdf?src-supplier=Digi-Key; ComponentLink5Description: https://datasheet.ciiva.com/2453/pyu-r-int-thick-7-2453361.pdf?src-supplier=Digi-Key; ComponentLink6URL: https://datasheet.ciiva.com/12667/pyu-rc0402-51-rohs-l-6-r-12667930.pdf?src-supplier=Mouser; ComponentLink6Description: https://datasheet.ciiva.com/12667/pyu-rc0402-51-rohs-l-6-r-12667930.pdf?src-supplier=Mouser; ComponentLink7URL: https://datasheet.ciiva.com/15189/getdatasheetpartid-323696-15189334.pdf?src-supplier=Verical; ComponentLink7Description: https://datasheet.ciiva.com/15189/getdatasheetpartid-323696-15189334.pdf?src-supplier=Verical; Supplier Part Number 1: 603-RC0402FR-07100KL
RV1 = ERZ-V07D680: VARISTOR 68V 500A DISC 7MM; Manufacturer: Panasonic; Max Voltage Rating (AC): 40V; Max Voltage Rating (DC): 56V; Capacitance: 1.2nF; Lead/Base Style: Radial; Clamping Voltage: 135V; Clamping Current: 2.5A; Voltage Rating: 75V; Min Varistor Voltage: 61V; Number of Circuits: 1; Energy: 4.1J; Power Rating: 20mW; Supplier 1: Avnet; Manufacturer Part Number: ERZ-V07D680; RoHS: Yes; Category: Varistors; Stock 1: 397; Pricing 1: 1000=0.07517, 1100=0.07421, 2100=0.07294, 5000=0.07103, 10000=0.07039 (USD); Mount: Through Hole,Radial; Case/Package: Radial; Contact Plating: Tin,Matte; Material: Zinc; Min Operating Temperature: -40°C; Max Operating Temperature: 85°C; Max Surge Current: 500A; Voltage Rating (DC): 56V; Voltage Rating (AC): 40V; Packaging: Bulk; Varistor Voltage: 68V; Termination: Radial; Package Quantity: 1000; Max Varistor Voltage: 75V; Max Output Current: 2.5A; Diameter: 7mm; Lead Pitch: 5mm; Depth: 5.2mm; Thickness: 5.2mm; Radiation Hardening: No; Lead Free: Lead Free; ComponentLink1URL: https://datasheet.ciiva.com/11834/0900766b80eefb4d-11834669.pdf?src-supplier=RSComponents; ComponentLink1Description: https://datasheet.ciiva.com/11834/0900766b80eefb4d-11834669.pdf?src-supplier=RSComponents; ComponentLink2URL: https://datasheet.ciiva.com/1278/652464-1278833.pdf?src-supplier=Element14; ComponentLink2Description: https://datasheet.ciiva.com/1278/652464-1278833.pdf?src-supplier=Element14; ComponentLink3URL: https://datasheet.ciiva.com/1283/652464-1283255.pdf?src-supplier=Farnell; ComponentLink3Description: https://datasheet.ciiva.com/1283/652464-1283255.pdf?src-supplier=Farnell; ComponentLink4URL: https://datasheet.ciiva.com/3023/awa0000ce2-3023960.pdf?src-supplier=Avnet; ComponentLink4Description: https://datasheet.ciiva.com/3023/awa0000ce2-3023960.pdf?src-supplier=Avnet; ComponentLink5URL: https://datasheet.ciiva.com/30133/2awa0000ce2-30133483.pdf?src-supplier=Onlinecomponents.com; ComponentLink5Description: https://datasheet.ciiva.com/30133/2awa0000ce2-30133483.pdf?src-supplier=Onlinecomponents.com; ComponentLink6URL: https://datasheet.ciiva.com/16440/awa0000ce2-16440124.pdf?src-supplier=Future+Electronics; ComponentLink6Description: https://datasheet.ciiva.com/16440/awa0000ce2-16440124.pdf?src-supplier=Future+Electronics; ComponentLink7URL: https://datasheet.ciiva.com/24028/awa0000ce2-33884-24028073.pdf?src-supplier=Mouser; ComponentLink7Description: https://datasheet.ciiva.com/24028/awa0000ce2-33884-24028073.pdf?src-supplier=Mouser; ComponentLink8URL: https://datasheet.ciiva.com/1231/652464-1231981.pdf?src-supplier=Newark; ComponentLink8Description: https://datasheet.ciiva.com/1231/652464-1231981.pdf?src-supplier=Newark; Supplier Part Number 1: ERZ-V07D680; LCSC Part Number: C1527506; Item Type: Varistor
U11 = OR-3H7B-TP-G: 80V 3750V 2us@2mA,100Ω -55℃~+125℃ 50mA 3us@2mA,100Ω 0.4V@2.4mA,8mA 1 6V 1.2V Phototransistor DC SOP-4-2.6mm Optocouplers - Phototransistor Output ROHS; Manufacturer: Orient; Manufacturer Part Number: OR-3H7B-TP-G; Package: SOP-4-2.6mm; LCSC Part Number: C282477; Item Type: Optocoupler; ComponentLink1Description: LCSC; ComponentLink1URL: https://www.lcsc.com/product-detail/Optocouplers-Phototransistor-Output_Orient-OR-3H7B-TP-G_C282477.html

## Sheet Output-Connection-Sheet.SchDoc
size A4; SheetNumber: 5; SheetTotal: 9
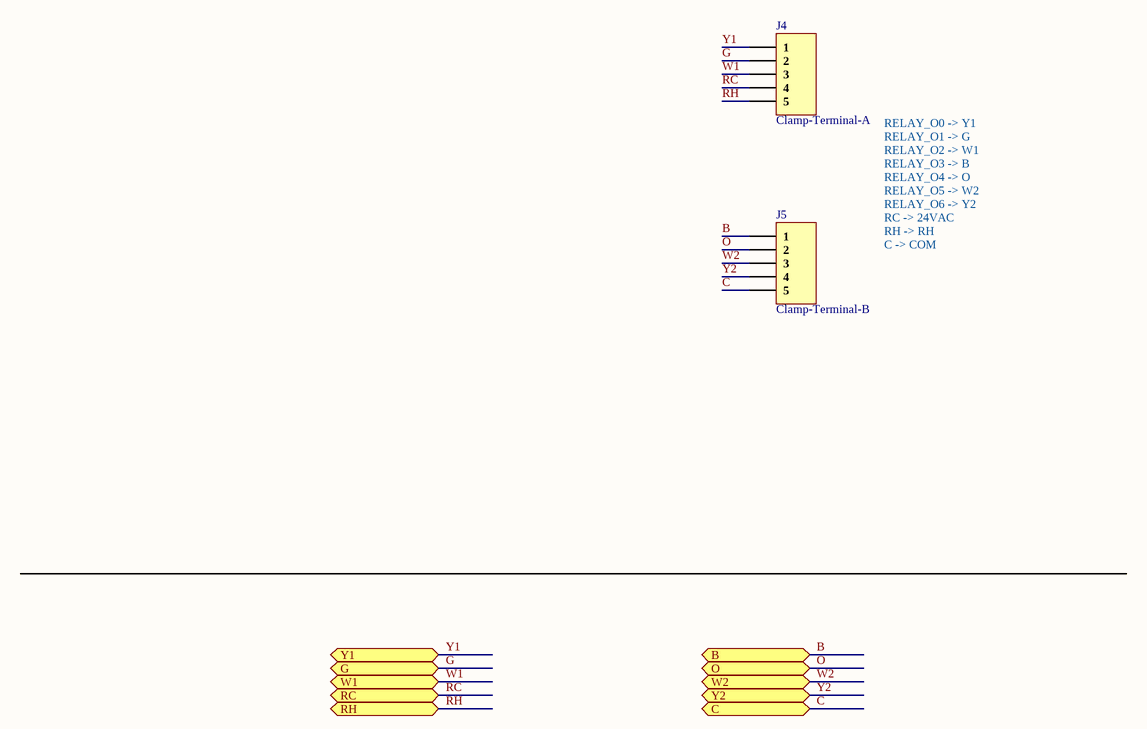
[diagram p3: Output-Connection-Sheet.SchDoc]

### Parts
J4  Clamp-Terminal-A  [Clamp-Terminal-A]
J5  Clamp-Terminal-B  [Clamp-Terminal-B.]

### Ports
B (bidir), C (bidir), G (bidir), O (bidir), RC (bidir), RH (bidir), W1 (bidir), W2 (bidir), Y1 (bidir), Y2 (bidir)

### Nets
B: J5.1 ; port B
C: J5.5 ; port C
G: J4.2 ; port G
O: J5.2 ; port O
RC: J4.4 ; port RC
RH: J4.5 ; port RH  [project net RELAY_IN]
W1: J4.3 ; port W1  [project net RELAY_O2]
W2: J5.3 ; port W2  [project net RELAY_O5]
Y1: J4.1 ; port Y1  [project net RELAY_O0]
Y2: J5.4 ; port Y2  [project net RELAY_O6]

### Notes on the sheet
- RELAY_O0 -> Y1
  RELAY_O1 -> G
  RELAY_O2 -> W1
  RELAY_O3 -> B
  RELAY_O4 -> O
  RELAY_O5 -> W2
  RELAY_O6 -> Y2
  RC -> 24VAC
  RH -> RH
  C -> COM
- File:
- Title:
- Date:
- Page
- Num:
- Total:
- Drawn By: Huzaifa Ali

### Library data of the parts
J4 = Clamp-Terminal-A: PinHeader_1x05_P5.00mm_Vertical
J5 = Clamp-Terminal-B: PinHeader_1x05_P5.00mm_Vertical

## Sheet ESP32-Sheet.SchDoc: =Projectname
size A4; SheetNumber: 8; SheetTotal: 9
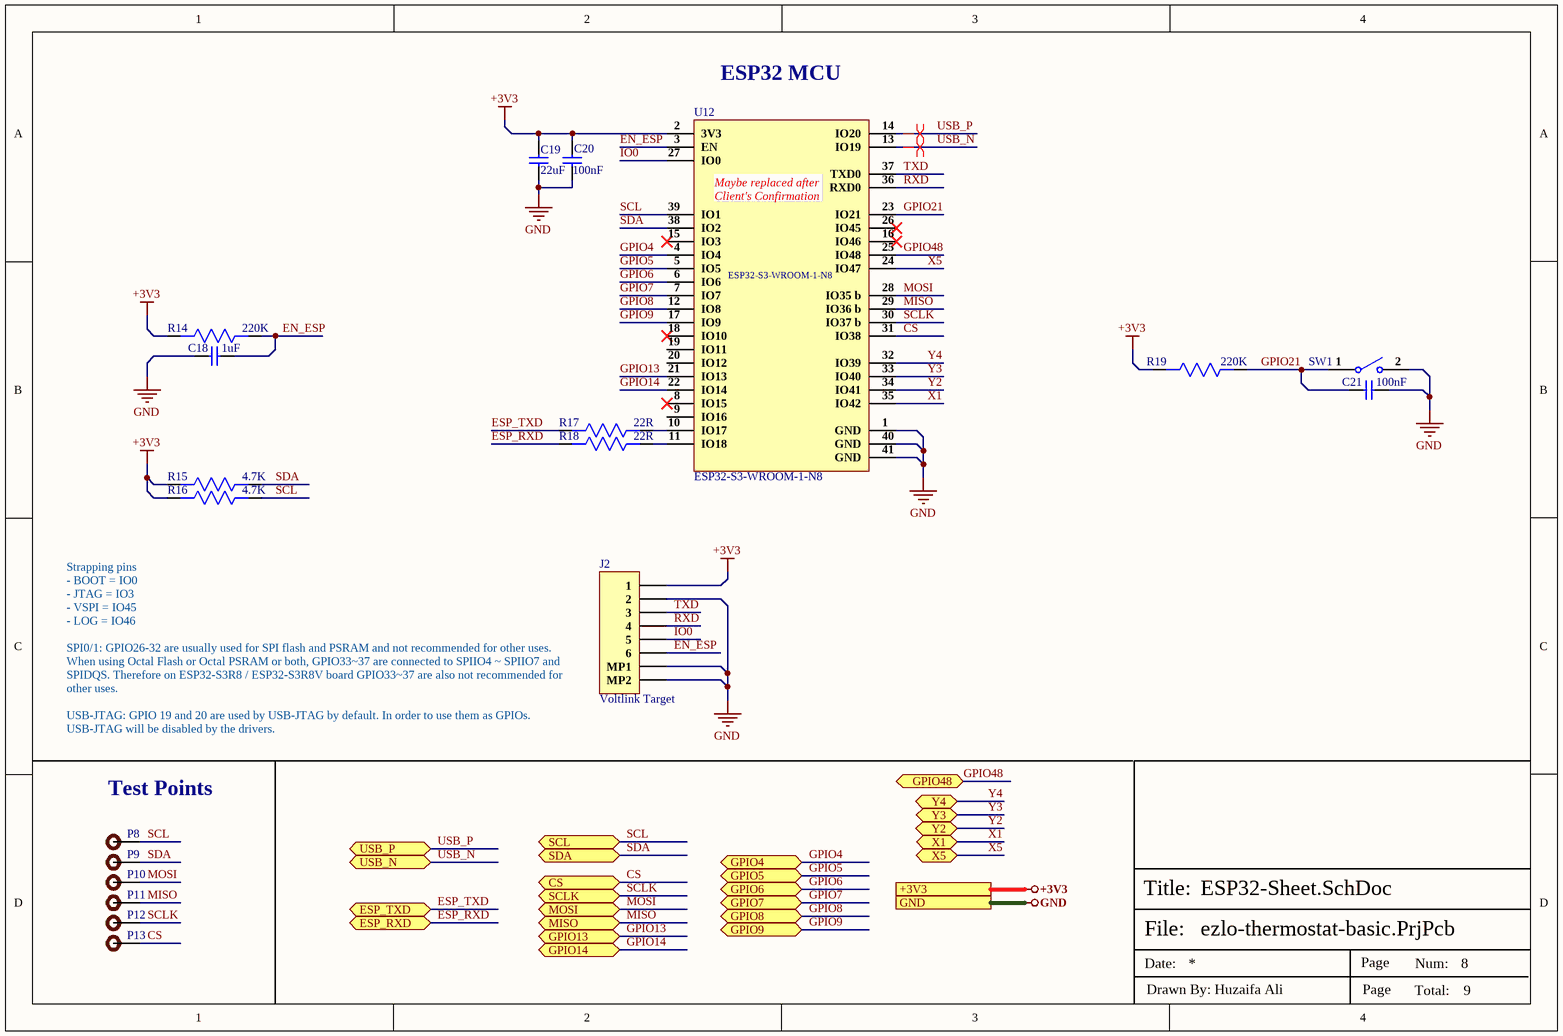
[diagram p4: ESP32-Sheet.SchDoc]

### Parts
C18  1uF  [Cap-0402]
C19  22uF  [Cap-0603]
C20  100nF  [Cap-0402]
C21  100nF  [Cap-0402]
J2  Voltlink Target  [Voltlink Target]
P8  TEST POINT  [Test-point]  (value not drawn)
P9  TEST POINT  [Test-point]  (value not drawn)
P10  TEST POINT  [Test-point]  (value not drawn)
P11  TEST POINT  [Test-point]  (value not drawn)
P12  TEST POINT  [Test-point]  (value not drawn)
P13  TEST POINT  [Test-point]  (value not drawn)
R14  220K  [Res-0402]
R15  4.7K  [Res-0402]
R16  4.7K  [Res-0402]
R17  22R  [Res-0402]
R18  22R  [Res-0402]
R19  220K  [Res-0402]
SW1  YTS-B003-2A  [YTS-B003-2A]  (value not drawn)
U12  ESP32-S3-WROOM-1-N8  [41-SMD Module]

### Ports
+3V3, CS (bidir), ESP_RXD (bidir), ESP_TXD (bidir), GND, GPIO4 (bidir), GPIO5 (bidir), GPIO6 (bidir), GPIO7 (bidir), GPIO8 (bidir), GPIO9 (bidir), GPIO13 (bidir), GPIO14 (bidir), GPIO48 (bidir), MISO (bidir), MOSI (bidir), SCL (bidir), SCLK (bidir), SDA (bidir), USB_N (bidir), USB_P (bidir), X1 (bidir), X5 (bidir), Y2 (bidir), Y3 (bidir), Y4 (bidir)

### Nets
+3V3: C19.1 C20.1 J2.1 R14.2 R15.2 R16.2 R19.2 U12.2(3V3) ; port +3V3
GND: C18.1 C19.2 C20.2 C21.2 J2.2 J2.MP1 J2.MP2 SW1.2(NO) U12.1(GND) U12.40(GND) U12.41(GND) ; port GND
CS: P13.1 U12.31(IO38) ; port CS
EN_ESP: C18.2 J2.6 R14.1 U12.3(EN)
ESP_RXD: R18.2 ; port ESP_RXD
ESP_TXD: R17.2 ; port ESP_TXD
GPIO4: U12.4(IO4) ; port GPIO4
GPIO5: U12.5(IO5) ; port GPIO5
GPIO6: U12.6(IO6) ; port GPIO6
GPIO7: U12.7(IO7) ; port GPIO7
GPIO8: U12.12(IO8) ; port GPIO8
GPIO9: U12.17(IO9) ; port GPIO9
GPIO13: U12.21(IO13) ; port GPIO13
GPIO14: U12.22(IO14) ; port GPIO14
GPIO21: C21.1 R19.1 SW1.1(COMMON) U12.23(IO21)
GPIO48: U12.25(IO48) ; port GPIO48
IO0: J2.5 U12.27(IO0)
MISO: P11.1 U12.29(IO36_b) ; port MISO
MOSI: P10.1 U12.28(IO35_b) ; port MOSI
RXD: J2.4 U12.36(RXD0)
SCL: P8.1 R16.1 U12.39(IO1) ; port SCL
SCLK: P12.1 U12.30(IO37_b) ; port SCLK
SDA: P9.1 R15.1 U12.38(IO2) ; port SDA
TXD: J2.3 U12.37(TXD0)
USB_N: U12.13(IO19) ; port USB_N
USB_P: U12.14(IO20) ; port USB_P
X1: U12.35(IO42) ; port X1
X5: U12.24(IO47) ; port X5
Y2: U12.34(IO41) ; port Y2
Y3: U12.33(IO40) ; port Y3
Y4: U12.32(IO39) ; port Y4
NetR17_1: R17.1 U12.10(IO17)
NetR18_1: R18.1 U12.11(IO18)

Not connected (* = marked no-connect by the designer): U12 8(IO15)* 9(IO16) 15(IO3)* 16(IO46)* 18(IO10)* 19(IO11) 20(IO12) 26(IO45)*

### Layout directives
differential pair; net class USB; differential pair class USB_Lines; rule Impedance Constraint [Min = 85.00    Max = 90.00    ]; rule Matched Net Lengths [Tolerance = 50mil]: USB_N, USB_P

### Notes on the sheet
- (near U12) ESP32 MCU
- (near U12) Maybe replaced after Client's Confirmation
- Strapping pins
  - BOOT = IO0
  - JTAG = IO3
  - VSPI = IO45
  - LOG = IO46
  SPI0/1: GPIO26-32 are usually used for SPI flash and PSRAM and not recommended for other uses.
  When using Octal Flash or Octal PSRAM or both, GPIO33~37 are connected to SPIIO4 ~ SPIIO7 and SPIDQS. Therefore on ESP32-S3R8 / ESP32-S3R8V board GPIO33~37 are also not recommended for other uses.
  USB-JTAG: GPIO 19 and 20 are used by USB-JTAG by default. In order to use them as GPIOs. USB-JTAG will be disabled by the drivers.
- Test Points
- File:
- Title:
- Date:
- Page
- Num:
- Total:
- Drawn By: Huzaifa Ali

### Library data of the parts
C18 = CC0402KRX5R8BB105: CAP CER 1UF 25V X5R 0402; Manufacturer: Yageo; Tolerance: 10%; Supplier 1: Mouser; Manufacturer Part Number: CC0402KRX5R8BB105; RoHS: Yes; Category: Ceramic Capacitors; Stock 1: 91975; Pricing 1: 1=0.30000, 10=0.20400, 50=0.20400, 100=0.11600, 1000=0.07200, 10000=0.05900 (USD); Mount: Surface Mount; Case/Package: 0402; Case Code (Metric): 1005; Case Code (Imperial): 0402; Weight: 2.3E-05oz; Min Operating Temperature: -55°C; Max Operating Temperature: 85°C; Packaging: Tape and Reel; Capacitance: 1uF; Voltage Rating: 25V; Dielectric: X5R; Termination: SMD/SMT; Voltage Rating (DC): 25V; Package Quantity: 10000; Length: 0.039inch; Width: 0.02inch; Thickness: 0.022inch; Lead Free: Lead Free; Halogen Free: Halogen Free; RoHS Compliant: Yes; ComponentLink1URL: http://www.mouser.com/ds/2/447/Yageo_UPY-GP_NP0_16V-to-50V_9-358835.pdf?src-supplier=Mouser; ComponentLink1Description: http://www.mouser.com/ds/2/447/Yageo_UPY-GP_NP0_16V-to-50V_9-358835.pdf?src-supplier=Mouser; ComponentLink2URL: http://www.yageo.com/documents/recent/UPY-GPHC_X5R_4V-to-50V_25.pdf?src-supplier=Digi-Key; ComponentLink2Description: http://www.yageo.com/documents/recent/UPY-GPHC_X5R_4V-to-50V_25.pdf?src-supplier=Digi-Key; ComponentLink3URL: https://4donline.ihs.com/images/VipMasterIC/IC/YAGO/YAGO-S-A0006851646/YAGO-S-A0006851646-1.pdf?hkey=6D3A4C79FDBF58556ACFDE234799DDF0&src-supplier=Newark; ComponentLink3Description: https://4donline.ihs.com/images/VipMasterIC/IC/YAGO/YAGO-S-A0006851646/YAGO-S-A0006851646-1.pdf?hkey=6D3A4C79FDBF58556ACFDE234799DDF0&src-supplier=Newark; Supplier Part Number 1: 603-CC402KRX5R8BB105; LCSC Part Number: C326568
C19 = CC0603MRX5R5BB226: CAP CER 22UF 6.3V X5R 0603; Manufacturer: Yageo; Tolerance: 20%; Supplier 1: Mouser; Manufacturer Part Number: CC0603MRX5R5BB226; RoHS: Yes; Category: Ceramic Capacitors; Stock 1: 3030; Pricing 1: 1=0.33000, 10=0.22500, 50=0.22500, 100=0.12800, 1000=0.07900, 10000=0.06500 (USD); Mount: Surface Mount; Case/Package: 0603; Case Code (Metric): 1608; Case Code (Imperial): 0603; Weight: 7.1E-05oz; Min Operating Temperature: -55°C; Max Operating Temperature: 85°C; Capacitance: 22uF; Packaging: Tape and Reel; Dielectric: X5R; Voltage Rating: 6.3V; Termination: SMD/SMT; Resistor Type: Ceramic; Voltage Rating (DC): 6.3V; Package Quantity: 4000; Length: 0.063inch; Width: 0.031inch; Thickness: 0.035inch; Depth: 0.8mm; Lead Free: Lead Free; Halogen Free: Halogen Free; RoHS Compliant: Yes; ComponentLink1URL: http://www.mouser.com/ds/2/447/Yageo_UPY-GP_NP0_16V-to-50V_9-358835.pdf?src-supplier=Mouser; ComponentLink1Description: http://www.mouser.com/ds/2/447/Yageo_UPY-GP_NP0_16V-to-50V_9-358835.pdf?src-supplier=Mouser; ComponentLink2URL: http://www.yageo.com/documents/recent/UPY-GPHC_X5R_4V-to-50V_25.pdf?src-supplier=Digi-Key; ComponentLink2Description: http://www.yageo.com/documents/recent/UPY-GPHC_X5R_4V-to-50V_25.pdf?src-supplier=Digi-Key; Supplier Part Number 1: 603-CC603MRX5R5BB226; LCSC Part Number: C109448
C20 C21 = CC0402KRX5R8BB104: as C9 on sheet Output-Sheet; Supplier 1: Digi-Key; Manufacturer Part Number: CC0402KRX5R8BB104; RoHS: Yes; Category: Ceramic Capacitors; Stock 1: 4598218; Pricing 1: 1=0.10000, 10=0.03800, 50=0.02100, 100=0.01710, 500=0.01224, 1000=0.00961, 2500=0.00874, 5000=0.00804 (USD); Mount: Surface Mount; Case/Package: 0402; Case Code (Metric): 1005; Case Code (Imperial): 0402; Min Operating Temperature: -55°C; Max Operating Temperature: 85°C; Voltage Rating: 25V; Packaging: Tape and Reel; Capacitance: 100nF; Voltage Rating (DC): 25V; Dielectric: X5R; Resistor Type: Ceramic; Series: CC; Length: 0.039inch; Width: 0.02inch; Thickness: 0.022inch; Depth: 0.5mm; Lead Free: Lead Free; Halogen Free: Halogen Free; RoHS Compliant: Yes; ComponentLink1URL: http://www.mouser.com/ds/2/447/UPY-GPHC_X5R_4V-to-50V_25-1131599.pdf?src-supplier=Mouser; ComponentLink1Description: http://www.mouser.com/ds/2/447/UPY-GPHC_X5R_4V-to-50V_25-1131599.pdf?src-supplier=Mouser; ComponentLink2URL: http://www.yageo.com/documents/recent/UPY-GPHC_X5R_4V-to-50V-16.pdf?src-supplier=Future+Electronics; ComponentLink2Description: http://www.yageo.com/documents/recent/UPY-GPHC_X5R_4V-to-50V-16.pdf?src-supplier=Future+Electronics; ComponentLink3URL: http://www.yageo.com/documents/recent/UPY-GPHC_X5R_4V-to-50V_25.pdf?src-supplier=Digi-Key; ComponentLink3Description: http://www.yageo.com/documents/recent/UPY-GPHC_X5R_4V-to-50V_25.pdf?src-supplier=Digi-Key; Supplier Part Number 1: 311-1697-1-ND; LCSC Part Number: C106256
J2 = C145963: 1x6P SH 1 1mm 6 SMD,P=1mm Wire To Board / Wire To Wire Connector ROHS; Manufacturer: BOOMELE; Manufacturer Part Number: C145963; Package: SMD,P=1mm; LCSC Part Number: C145963; Item Type: Connector; ComponentLink1Description: LCSC; ComponentLink1URL: https://www.lcsc.com/product-detail/Wire-To-Board-Wire-To-Wire-Connector_BOOMELE-Boom-Precision-Elec-C145963_C145963.html
P8-P13 = TEST POINT: Test Point ON
R14 R19 = RC0402FR-07220KL: as R4 on sheet Output-Sheet; Supplier 1: Digi-Key; Manufacturer Part Number: RC0402FR-07220KL; RoHS: Yes; Category: Chip SMD Resistors; Stock 1: 1192792; Pricing 1: 1=0.10000, 10=0.01400, 100=0.00580, 1000=0.00262, 2500=0.00228, 5000=0.00188 (USD); Case/Package: 0402; Case Code (Imperial): 0402; Case Code (Metric): 1005; Weight: 2.3E-05oz; Size Code: 0402; Min Operating Temperature: -55°C; Max Operating Temperature: 155°C; Tolerance: 1%; Package Quantity: 1; Packaging: Tape and Reel; Termination: SMD/SMT; Resistor Type: Thick Film; Number of Terminations: 2; Features: Moisture Resistant; Series: RC; Resistance Tolerance: 1%; Technology: THICK FILM; Construction: Rectangular; Length: 1mm; Width: 0.02inch; Height: 0.016inch; Depth: 0.5mm; RoHS Compliant: Yes; Reach SVHC Compliant: Yes; Military Standard: Not; Lead Free: Lead Free; ComponentLink1URL: https://datasheet.ciiva.com/11808/0900766b80c66297-11808792.pdf?src-supplier=RSComponents; ComponentLink1Description: https://datasheet.ciiva.com/11808/0900766b80c66297-11808792.pdf?src-supplier=RSComponents; ComponentLink2URL: https://datasheet.ciiva.com/5924/1018594-5924944.pdf?src-supplier=Farnell; ComponentLink2Description: https://datasheet.ciiva.com/5924/1018594-5924944.pdf?src-supplier=Farnell; ComponentLink3URL: https://datasheet.ciiva.com/2453/pyu-r-int-thick-7-2453533.pdf?src-supplier=Digi-Key; ComponentLink3Description: https://datasheet.ciiva.com/2453/pyu-r-int-thick-7-2453533.pdf?src-supplier=Digi-Key; ComponentLink4URL: https://datasheet.ciiva.com/2453/pyu-r-int-thick-7-2453534.pdf?src-supplier=Digi-Key; ComponentLink4Description: https://datasheet.ciiva.com/2453/pyu-r-int-thick-7-2453534.pdf?src-supplier=Digi-Key; ComponentLink5URL: https://datasheet.ciiva.com/2453/pyu-r-int-thick-7-2453532.pdf?src-supplier=Digi-Key; ComponentLink5Description: https://datasheet.ciiva.com/2453/pyu-r-int-thick-7-2453532.pdf?src-supplier=Digi-Key; ComponentLink6URL: https://datasheet.ciiva.com/12577/pyu-rc0402-51-rohs-l-6-r-12577270.pdf?src-supplier=Mouser; ComponentLink6Description: https://datasheet.ciiva.com/12577/pyu-rc0402-51-rohs-l-6-r-12577270.pdf?src-supplier=Mouser; Supplier Part Number 1: 311-220KLRCT-ND
R15 R16 = RC0402FR-074K7L: RES 4.7K OHM 1% 1/16W 0402; Manufacturer: Yageo; Voltage Rating (DC): 50V; Power Rating: 62.5mW; Resistance: 4.7kR; Temperature Coefficient: 100ppm/°C; Max Power Dissipation: 63mW; Item Type: Resistor; Supplier 1: Avnet; Manufacturer Part Number: RC0402FR-074K7L; RoHS: Yes; Category: Chip SMD Resistors; Stock 1: 2420000; Pricing 1: 10000=0.00085 (USD); Case/Package: 0402; Number of Pins: 2; Case Code (Imperial): 0402; Case Code (Metric): 1005; Size Code: 0402; Min Operating Temperature: -55°C; Max Operating Temperature: 155°C; Tolerance: 1%; Voltage Rating: 50V; Packaging: Tape and Reel; Resistor Type: Thick Film; Termination: SMD/SMT; Features: Moisture Resistant; Series: RC; Number of Terminations: 2; Resistance Tolerance: 1%; Construction: Rectangular; Length: 1mm; Width: 0.5mm; Height: 0.32mm; Depth: 0.5mm; Height - Seated (Max): 0.016inch; RoHS Compliant: Yes; Reach SVHC Compliant: Yes; Military Standard: Not; Lead Free: Lead Free; ComponentLink1URL: https://datasheet.ciiva.com/22661/1686128-22661342.pdf?src-supplier=Element14; ComponentLink1Description: https://datasheet.ciiva.com/22661/1686128-22661342.pdf?src-supplier=Element14; ComponentLink2URL: https://datasheet.ciiva.com/7850/1018594-7850022.pdf?src-supplier=Element14; ComponentLink2Description: https://datasheet.ciiva.com/7850/1018594-7850022.pdf?src-supplier=Element14; ComponentLink3URL: https://datasheet.ciiva.com/7850/1018594-7850023.pdf?src-supplier=Element14; ComponentLink3Description: https://datasheet.ciiva.com/7850/1018594-7850023.pdf?src-supplier=Element14; ComponentLink4URL: https://datasheet.ciiva.com/15215/getdatasheetpartid-328119-15215035.pdf?src-supplier=Verical; ComponentLink4Description: https://datasheet.ciiva.com/15215/getdatasheetpartid-328119-15215035.pdf?src-supplier=Verical; Supplier Part Number 1: RC0402FR-074K7L; LCSC Part Number: C105871
R17 R18 = RC0402FR-0722RL: RES 22 OHM 1% 1/16W 0402; Manufacturer: Yageo; Voltage Rating: 50V; Power Rating: 62.5mW; Temperature Coefficient: 100ppm/°C; Max Power Dissipation: 63mW; Item Type: Resistor; Supplier 1: Avnet; Manufacturer Part Number: RC0402FR-0722RL; RoHS: Yes; Category: Chip SMD Resistors; Stock 1: 1810000; Pricing 1: 10000=0.00085 (USD); Case/Package: 0402; Number of Pins: 2; Case Code (Imperial): 0402; Case Code (Metric): 1005; Size Code: 0402; Min Operating Temperature: -55°C; Max Operating Temperature: 155°C; Resistor Type: Thick Film; Voltage Rating (DC): 50V; Resistance: 22R; Tolerance: 1%; Packaging: Tape and Reel; Termination: SMD/SMT; Features: Moisture Resistant; Series: RC; Number of Terminations: 2; Resistance Tolerance: 1%; Technology: THICK FILM; Construction: Rectangular; Length: 1mm; Width: 0.5mm; Height: 0.32mm; Depth: 0.5mm; RoHS Compliant: Yes; Reach SVHC Compliant: Yes; Military Standard: Not; Lead Free: Lead Free; ComponentLink1URL: https://datasheet.ciiva.com/11819/0900766b80c66297-11819462.pdf?src-supplier=RSComponents; ComponentLink1Description: https://datasheet.ciiva.com/11819/0900766b80c66297-11819462.pdf?src-supplier=RSComponents; ComponentLink2URL: https://datasheet.ciiva.com/7849/1018594-7849912.pdf?src-supplier=Element14; ComponentLink2Description: https://datasheet.ciiva.com/7849/1018594-7849912.pdf?src-supplier=Element14; ComponentLink3URL: https://datasheet.ciiva.com/7849/1018594-7849911.pdf?src-supplier=Element14; ComponentLink3Description: https://datasheet.ciiva.com/7849/1018594-7849911.pdf?src-supplier=Element14; ComponentLink4URL: https://datasheet.ciiva.com/16930/pyu-rc0402-51-rohs-l-6-r-16930687.pdf?src-supplier=Future+Electronics; ComponentLink4Description: https://datasheet.ciiva.com/16930/pyu-rc0402-51-rohs-l-6-r-16930687.pdf?src-supplier=Future+Electronics; ComponentLink5URL: https://datasheet.ciiva.com/26829/getdatasheetpartid-554995-26829991.pdf?src-supplier=Verical; ComponentLink5Description: https://datasheet.ciiva.com/26829/getdatasheetpartid-554995-26829991.pdf?src-supplier=Verical; Supplier Part Number 1: RC0402FR-0722RL; LCSC Part Number: C114765
SW1 = YTS-B003-2A: 3.5mm 3.5mm SMDSplicing Black Rectangle button 50mA Surface Mount 7mm SPST 100MΩ 20000 12V 250gf@±50gf SMD Tactile Switches ROHS; Manufacturer: YIYUAN; Manufacturer Part Number: YTS-B003-2A; Package: Custom; LCSC Part Number: C2910695; ComponentLink1Description: LCSC; ComponentLink1URL: https://lcsc.com/product-detail/Tactile-Switches_YIYUAN-YTS-B003-2A_C2910695.html; Item Type: Tactile Switch
U12 = ESP32-S3-WROOM-1-N8: SMD MODULE, ESP32-S3, 8 MB SPI F; Manufacturer: Espressif Systems; Supplier 1: Digi-Key; Manufacturer Part Number: ESP32-S3-WROOM-1-N8; RoHS: No; Category: Uncategorized; Stock 1: 7933; Pricing 1: 1=3.52000 (USD); Supplier Part Number 1: 1965-ESP32-S3-WROOM-1-N8CT-ND; LCSC Part Number: C2913198; Item Type: Module; ComponentLink1Description: LCSC; ComponentLink1URL: https://www.lcsc.com/product-detail/WiFi-Modules_Espressif-Systems-ESP32-S3-WROOM-1-N8_C2913198.html